# Altium schematic sheet Internal_Power_Sheet.SchDoc
size A4; DocumentNumber: 7; SheetNumber: 7; SheetTotal: 27
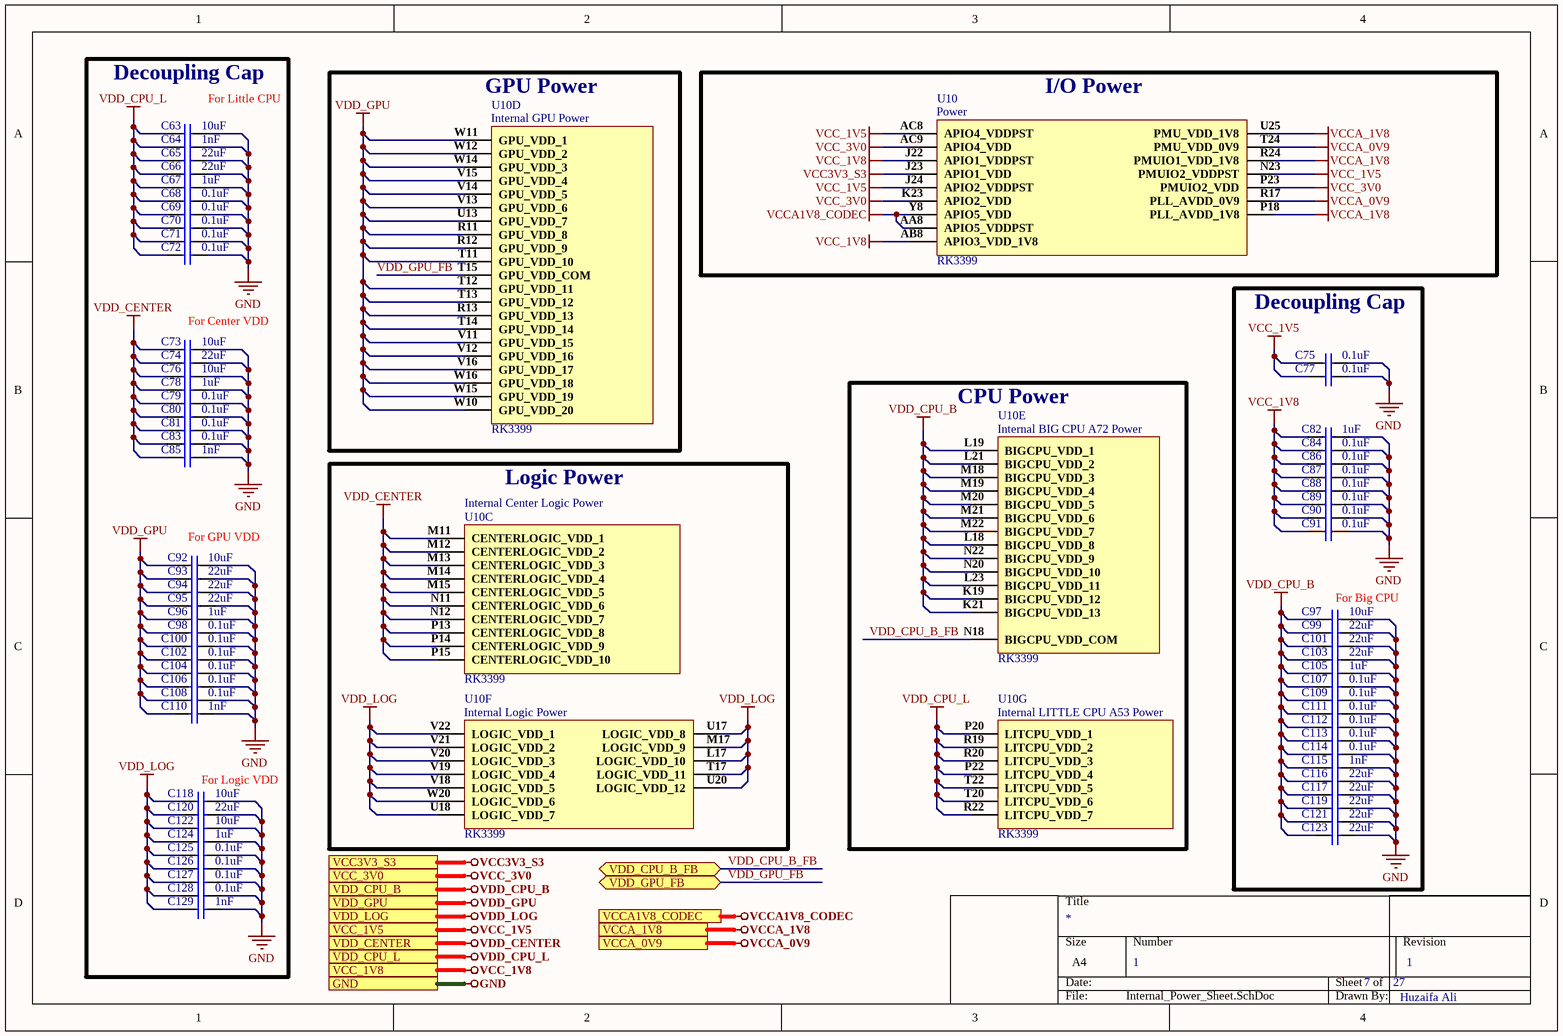
[diagram p0: Internal_Power_Sheet.SchDoc]

## Parts
C63  10uF  [Cap0603]
C64  1nF  [Cap0603]
C65  22uF  [Cap0805]
C66  22uF  [Cap0805]
C67  1uF  [Cap0402]
C68  0.1uF  [Cap0402]
C69  0.1uF  [Cap0402]
C70  0.1uF  [Cap0402]
C71  0.1uF  [Cap0402]
C72  0.1uF  [Cap0402]
C73  10uF  [Cap0603]
C74  22uF  [Cap0805]
C75  0.1uF  [Cap0402]
C76  10uF  [Cap0603]
C77  0.1uF  [Cap0402]
C78  1uF  [Cap0402]
C79  0.1uF  [Cap0402]
C80  0.1uF  [Cap0402]
C81  0.1uF  [Cap0402]
C82  1uF  [Cap0402]
C83  0.1uF  [Cap0402]
C84  0.1uF  [Cap0402]
C85  1nF  [Cap0603]
C86  0.1uF  [Cap0402]
C87  0.1uF  [Cap0402]
C88  0.1uF  [Cap0402]
C89  0.1uF  [Cap0402]
C90  0.1uF  [Cap0402]
C91  0.1uF  [Cap0402]
C92  10uF  [Cap0603]
C93  22uF  [Cap0805]
C94  22uF  [Cap0805]
C95  22uF  [Cap0805]
C96  1uF  [Cap0402]
C97  10uF  [Cap0603]
C98  0.1uF  [Cap0402]
C99  22uF  [Cap0805]
C100  0.1uF  [Cap0402]
C101  22uF  [Cap0805]
C102  0.1uF  [Cap0402]
C103  22uF  [Cap0805]
C104  0.1uF  [Cap0402]
C105  1uF  [Cap0402]
C106  0.1uF  [Cap0402]
C107  0.1uF  [Cap0402]
C108  0.1uF  [Cap0402]
C109  0.1uF  [Cap0402]
C110  1nF  [Cap0603]
C111  0.1uF  [Cap0402]
C112  0.1uF  [Cap 0402]
C113  0.1uF  [Cap0402]
C114  0.1uF  [Cap0402]
C115  1nF  [Cap0603]
C116  22uF  [Cap0805]
C117  22uF  [Cap0805]
C118  10uF  [Cap0603]
C119  22uF  [Cap0805]
C120  22uF  [Cap0805]
C121  22uF  [Cap0805]
C122  10uF  [Cap0603]
C123  22uF  [Cap0805]
C124  1uF  [Cap0402]
C125  0.1uF  [Cap0402]
C126  0.1uF  [Cap0402]
C127  0.1uF  [Cap0402]
C128  0.1uF  [Cap0402]
C129  1nF  [Cap0603]
U10  RK3399  [RK3399]  (parts C,D,E,F,G,29 of 34)

## Blocks framed on the sheet
Decoupling Cap: C63-C74 C76 C78-C81 C83 C85 C92-C96 C98 C100 C102 C104 C106 C108 C110 C118 C120 C122 C124-C129
GPU Power: U10
I/O Power: U10
Decoupling Cap: C75 C77 C82 C84 C86-C91 C97 C99 C101 C103 C105 C107 C109 C111-C117 C119 C121 C123
CPU Power: U10
Logic Power: U10

## Ports
GND, VCC3V3_S3, VCC_1V5, VCC_1V8, VCC_3V0, VCCA1V8_CODEC, VCCA_0V9, VCCA_1V8, VDD_CENTER, VDD_CPU_B, VDD_CPU_B_FB (bidir), VDD_CPU_L, VDD_GPU, VDD_GPU_FB (bidir), VDD_LOG

## Nets
GND: C63.2 C64.2 C65.2 C66.2 C67.2 C68.2 C69.2 C70.2 C71.2 C72.2 C73.2 C74.2 C75.2 C76.2 C77.2 C78.2 C79.2 C80.2 C81.2 C82.2 C83.2 C84.2 C85.2 C86.2 C87.2 C88.2 C89.2 C90.2 C91.2 C92.2 C93.2 C94.2 C95.2 C96.2 C97.2 C98.2 C99.2 C100.2 C101.2 C102.2 C103.2 C104.2 C105.2 C106.2 C107.2 C108.2 C109.2 C110.2 C111.2 C112.2 C113.2 C114.2 C115.2 C116.2 C117.2 C118.2 C119.2 C120.2 C121.2 C122.2 C123.2 C124.2 C125.2 C126.2 C127.2 C128.2 C129.2 ; port GND
VCC3V3_S3: U10.J23(APIO1_VDD) ; port VCC3V3_S3
VCC_1V5: C75.1 C77.1 U10.AC8(APIO4_VDDPST) U10.J24(APIO2_VDDPST) U10.N23(PMUIO2_VDDPST) ; port VCC_1V5
VCC_1V8: C82.1 C84.1 C86.1 C87.1 C88.1 C89.1 C90.1 C91.1 U10.AB8(APIO3_VDD_1V8) U10.J22(APIO1_VDDPST) ; port VCC_1V8
VCC_3V0: U10.AC9(APIO4_VDD) U10.K23(APIO2_VDD) U10.P23(PMUIO2_VDD) ; port VCC_3V0
VCCA1V8_CODEC: U10.AA8(APIO5_VDDPST) U10.Y8(APIO5_VDD) ; port VCCA1V8_CODEC
VCCA_0V9: U10.R17(PLL_AVDD_0V9) U10.T24(PMU_VDD_0V9) ; port VCCA_0V9
VCCA_1V8: U10.P18(PLL_AVDD_1V8) U10.R24(PMUIO1_VDD_1V8) U10.U25(PMU_VDD_1V8) ; port VCCA_1V8
VDD_CENTER: C73.1 C74.1 C76.1 C78.1 C79.1 C80.1 C81.1 C83.1 C85.1 U10.M11(CENTERLOGIC_VDD_1) U10.M12(CENTERLOGIC_VDD_2) U10.M13(CENTERLOGIC_VDD_3) U10.M14(CENTERLOGIC_VDD_4) U10.M15(CENTERLOGIC_VDD_5) U10.N11(CENTERLOGIC_VDD_6) U10.N12(CENTERLOGIC_VDD_7) U10.P13(CENTERLOGIC_VDD_8) U10.P14(CENTERLOGIC_VDD_9) U10.P15(CENTERLOGIC_VDD_10) ; port VDD_CENTER
VDD_CPU_B: C97.1 C99.1 C101.1 C103.1 C105.1 C107.1 C109.1 C111.1 C112.1 C113.1 C114.1 C115.1 C116.1 C117.1 C119.1 C121.1 C123.1 U10.K19(BIGCPU_VDD_12) U10.K21(BIGCPU_VDD_13) U10.L18(BIGCPU_VDD_8) U10.L19(BIGCPU_VDD_1) U10.L21(BIGCPU_VDD_2) U10.L23(BIGCPU_VDD_11) U10.M18(BIGCPU_VDD_3) U10.M19(BIGCPU_VDD_4) U10.M20(BIGCPU_VDD_5) U10.M21(BIGCPU_VDD_6) U10.M22(BIGCPU_VDD_7) U10.N20(BIGCPU_VDD_10) U10.N22(BIGCPU_VDD_9) ; port VDD_CPU_B
VDD_CPU_L: C63.1 C64.1 C65.1 C66.1 C67.1 C68.1 C69.1 C70.1 C71.1 C72.1 U10.P20(LITCPU_VDD_1) U10.P22(LITCPU_VDD_4) U10.R19(LITCPU_VDD_2) U10.R20(LITCPU_VDD_3) U10.R22(LITCPU_VDD_7) U10.T20(LITCPU_VDD_6) U10.T22(LITCPU_VDD_5) ; port VDD_CPU_L
VDD_GPU: C92.1 C93.1 C94.1 C95.1 C96.1 C98.1 C100.1 C102.1 C104.1 C106.1 C108.1 C110.1 U10.R11(GPU_VDD_8) U10.R12(GPU_VDD_9) U10.R13(GPU_VDD_13) U10.T11(GPU_VDD_10) U10.T12(GPU_VDD_11) U10.T13(GPU_VDD_12) U10.T14(GPU_VDD_14) U10.U13(GPU_VDD_7) U10.V11(GPU_VDD_15) U10.V12(GPU_VDD_16) U10.V13(GPU_VDD_6) U10.V14(GPU_VDD_5) U10.V15(GPU_VDD_4) U10.V16(GPU_VDD_17) U10.W10(GPU_VDD_20) U10.W11(GPU_VDD_1) U10.W12(GPU_VDD_2) U10.W14(GPU_VDD_3) U10.W15(GPU_VDD_19) U10.W16(GPU_VDD_18) ; port VDD_GPU
VDD_LOG: C118.1 C120.1 C122.1 C124.1 C125.1 C126.1 C127.1 C128.1 C129.1 U10.L17(LOGIC_VDD_10) U10.M17(LOGIC_VDD_9) U10.T17(LOGIC_VDD_11) U10.U17(LOGIC_VDD_8) U10.U18(LOGIC_VDD_7) U10.U20(LOGIC_VDD_12) U10.V18(LOGIC_VDD_5) U10.V19(LOGIC_VDD_4) U10.V20(LOGIC_VDD_3) U10.V21(LOGIC_VDD_2) U10.V22(LOGIC_VDD_1) U10.W20(LOGIC_VDD_6) ; port VDD_LOG
VDD_CPU_B_FB: U10.N18(BIGCPU_VDD_COM) ; port VDD_CPU_B_FB
VDD_GPU_FB: U10.T15(GPU_VDD_COM) ; port VDD_GPU_FB

## Notes on the sheet
- For Little CPU
- Text
- For Center VDD
- For GPU VDD
- (near C97) For Big CPU
- (near C118) For Logic VDD
- 1
- Huzaifa Ali
- (in symbol RK3399, part C) Internal Center Logic Power
- (in symbol RK3399, part D) Internal GPU Power
- (in symbol RK3399, part E) Internal BIG CPU A72 Power
- (in symbol RK3399, part F) Internal Logic Power
- (in symbol RK3399, part G) Internal LITTLE CPU A53 Power
- (in symbol RK3399, part 29) Power

## Library data of the parts
C63 C73 C76 C92 C97 C118 C122 = C1608X5R1E106M080AC: CAP CER 10UF 25V X5R 0603; Manufacturer: TDK; Dielectric Material: Ceramic; Tolerance: 20%; Supplier 1: Digi-Key; Manufacturer Part Number: C1608X5R1E106M080AC; Stock 1: 61681; Pricing 1: 1=0.96, 10=0.704, 100=0.483, 500=0.38238, 1000=0.322 (USD); Mount: Surface Mount; Case/Package: 0603; Weight: 7.1E-05oz; Case Code (Imperial): 0603; Case Code (Metric): 1608; Min Operating Temperature: -55°C; Max Operating Temperature: 85°C; Capacitance: 10uF; Packaging: Tape and Reel; Voltage Rating: 25V; Voltage Rating (DC): 25V; Termination: SMD/SMT; Package Quantity: 1; Dielectric: X5R; Composition: Ceramic; Length: 1.6mm; Height: 0.8mm; Width: 0.8mm; Thickness: 0.039inch; Depth: 0.8mm; Lead Free: Lead Free; REACH SVHC: No SVHC; Supplier Part Number 1: 445-9015-1-ND
C64 C85 C110 C115 C129 = CC0603KRX7R8BB102: CAP CER 0603 1nF 25 V ±10 % Tolerance X7R SMT; Manufacturer: Yageo; Tolerance: 10%; Voltage Rating: 25V; Supplier 1: Arrow Electronics; Manufacturer Part Number: CC0603KRX7R8BB102; RoHS: Yes; Category: Ceramic Capacitors; Stock 1: 974; Pricing 1: 1=0.07500, 10=0.04120, 25=0.04030, 100=0.02020, 250=0.02000, 500=0.01320 (USD); Mount: Surface Mount; Case/Package: 0603; Case Code (Imperial): 0603; Case Code (Metric): 1608; Weight: 7.1E-05oz; Min Operating Temperature: -55°C; Max Operating Temperature: 125°C; Capacitance: 1nF; Dielectric: X7R; Packaging: Tape and Reel; Voltage Rating (DC): 25V; Termination: SMD/SMT; Resistor Type: Ceramic; Series: CC; Construction: Flat; Length: 1.6mm; Width: 0.031inch; Height: 0.8mm; Thickness: 0.035inch; Depth: 0.8mm; Radiation Hardening: No; Lead Free: Lead Free; Halogen Free: Halogen Free; RoHS Compliant: Yes; ComponentLink1URL: https://datasheet.ciiva.com/13263/upy-gphc-x7r-6-3v-to-50v-8-12304-13263372.pdf?src-supplier=Mouser; ComponentLink1Description: https://datasheet.ciiva.com/13263/upy-gphc-x7r-6-3v-to-50v-8-12304-13263372.pdf?src-supplier=Mouser; Supplier Part Number 1: CC0603KRX7R8BB102
C65 C66 C74 C93-C95 C99 C101 C103 C116 C117 C119-C121 C123 = CL21A226MAYNNNE: 0803 22uF 25V X5R 20% multilayer ceramic capacitor; Manufacturer: Samsung; Supplier 1: Digi-Key; Manufacturer Part Number: CL21A226MAYNNNE; RoHS: Yes; Category: Ceramic Capacitors; Stock 1: 442950; Pricing 1: 2000=0.07687, 4000=0.07110, 10000=0.06726, 14000=0.06380, 50000=0.05765 (USD); RoHS Compliant: Yes; Supplier Part Number 1: 1276-CL21A226MAYNNNETR-ND
C67 C78 C82 C96 C105 C124 = GRM155R61E105KA12D: CAP CER 1UF 25V X5R 0402; Manufacturer: Murata; Material: Ceramic; Tolerance: 10%; Supplier 1: Digi-Key; Manufacturer Part Number: GRM155R61E105KA12D; Stock 1: 1194305; Pricing 1: 1=0.11, 10=0.077, 100=0.0363, 500=0.02546, 1000=0.02108, 2500=0.01962, 5000=0.01795 (USD); Mount: Surface Mount; Case/Package: 0402; Weight: 0.000212oz; Case Code (Metric): 1005; Case Code (Imperial): 0402; Min Operating Temperature: -55°C; Max Operating Temperature: 85°C; Capacitance: 1uF; Voltage Rating: 25V; Packaging: Tape and Reel; Dielectric: X5R; Voltage: 25V; Termination: SMD/SMT; Voltage Rating (DC): 25V; Package Quantity: 10000; Length: 1mm; Height: 0.5mm; Width: 0.5mm; Thickness: 0.022inch; Depth: 0.5mm; REACH SVHC: No SVHC; Lead Free: Lead Free; ComponentLink1URL: http://www.farnell.com/datasheets/2048341.pdf?src-supplier=Element14; ComponentLink1Description: http://www.farnell.com/datasheets/2048341.pdf?src-supplier=Element14; Supplier Part Number 1: 490-10017-1-ND
C68-C72 C75 C77 C79-C81 C83 C84 C86-C91 C98 C100 C102 C104 C106-C109 C111 C113 C114 C125-C128 = CC0402KRX5R6BB104: CAP CER 0.1UF 10V X5R 0402; Manufacturer: Yageo; Capacitance: 100nF; Tolerance: 10%; Dissipation Factor: 5%; Insulation Resistance: 10GR; Supplier 1: Digi-Key; Manufacturer Part Number: CC0402KRX5R6BB104; RoHS: Yes; Category: Ceramic Capacitors; Stock 1: 6385580; Pricing 1: 1=0.10000, 10=0.02700, 50=0.01500, 100=0.01220, 500=0.00874, 1000=0.00687, 2500=0.00625, 5000=0.00575 (USD); Mount: Surface Mount; Case/Package: 0402; Number of Pins: 2; Case Code (Imperial): 0402; Case Code (Metric): 1005; Min Operating Temperature: -55°C; Max Operating Temperature: 85°C; Dielectric: X5R; Packaging: Tape and Reel; Voltage Rating: 10V; Package Quantity: 1; Termination: SMD/SMT; Voltage Rating (DC): 10V; Series: CC; Length: 1mm; Width: 0.02inch; Height: 0.5mm; Depth: 0.5mm; Thickness: 0.022inch; Radiation Hardening: No; RoHS Compliant: Yes; REACH SVHC: No SVHC; Lead Free: Lead Free; Halogen Free: Halogen Free; ComponentLink1URL: https://datasheet.ciiva.com/144/mlccorderingcode-144029.pdf?src-supplier=Digi-Key; ComponentLink1Description: https://datasheet.ciiva.com/144/mlccorderingcode-144029.pdf?src-supplier=Digi-Key; ComponentLink2URL: https://datasheet.ciiva.com/144/mlccorderingcode-144028.pdf?src-supplier=Digi-Key; ComponentLink2Description: https://datasheet.ciiva.com/144/mlccorderingcode-144028.pdf?src-supplier=Digi-Key; ComponentLink3URL: https://datasheet.ciiva.com/144/mlccorderingcode-144030.pdf?src-supplier=Digi-Key; ComponentLink3Description: https://datasheet.ciiva.com/144/mlccorderingcode-144030.pdf?src-supplier=Digi-Key; ComponentLink4URL: https://datasheet.ciiva.com/7978/1359354-7978091.pdf?src-supplier=Element14; ComponentLink4Description: https://datasheet.ciiva.com/7978/1359354-7978091.pdf?src-supplier=Element14; ComponentLink5URL: https://datasheet.ciiva.com/11587/upy-gphc-x5r-4v-to-50v-12-11587302.pdf?src-supplier=Avnet; ComponentLink5Description: https://datasheet.ciiva.com/11587/upy-gphc-x5r-4v-to-50v-12-11587302.pdf?src-supplier=Avnet; Supplier Part Number 1: 311-1336-1-ND
C112 = GRM155R71H104ME14D: CAP CER 0.1UF 50V X7R 0402; Manufacturer: Murata; Tolerance: 20%; Capacitance: 100nF; Supplier 1: Digi-Key; Manufacturer Part Number: GRM155R71H104ME14D; Stock 1: 439844; Pricing 1: 1=0.1, 10=0.038, 100=0.0168, 500=0.01198, 1000=0.00941, 2500=0.00855, 5000=0.00787 (USD); Mount: Surface Mount; Case/Package: 0402; Min Operating Temperature: -55°C; Max Operating Temperature: 125°C; Packaging: Cut Tape; Voltage Rating: 50V; Length: 0.039inch; Width: 0.02inch; Thickness: 0.022inch; ComponentLink1URL: http://search.murata.co.jp/Ceramy/image/img/A01X/G101/ENG/GRM155R71H104ME14-01.pdf?src-supplier=Digi-Key; ComponentLink1Description: http://search.murata.co.jp/Ceramy/image/img/A01X/G101/ENG/GRM155R71H104ME14-01.pdf?src-supplier=Digi-Key; ComponentLink2URL: http://psearch.en.murata.com/capacitor/product/GRM155R71H104ME14%23.pdf?src-supplier=Avnet; ComponentLink2Description: http://psearch.en.murata.com/capacitor/product/GRM155R71H104ME14%23.pdf?src-supplier=Avnet; ComponentLink3URL: http://components.arrow.com/part/dataview/0323_07177683?src-supplier=Arrow+Europe; ComponentLink3Description: http://components.arrow.com/part/dataview/0323_07177683?src-supplier=Arrow+Europe; ComponentLink4URL: http://www.mouser.com/ds/2/281/c02e-2905.pdf?src-supplier=Mouser; ComponentLink4Description: http://www.mouser.com/ds/2/281/c02e-2905.pdf?src-supplier=Mouser; Supplier Part Number 1: 490-10701-1-ND
U10 = RK3399: RK3399 CPU BGA for HD set-top box chip BGA Chipse; Manufacturer: Fuzhou Rockchip Electronics; ComponentLink1Description: Aliexpress; ComponentLink1URL: https://www.aliexpress.com/item/1005001971093459.html?spm=a2g0n.productlist.0.0.3c7csv8Qsv8Quh&browser_id=3ac7e9efb8074641aaabc4d871f09748&aff_trace_key=&aff_platform=msite&m_page_id=181389a08711fc2600d8cc522bab8d702dd4189be0&gclid=&pdp_npi=2%40dis%21USD%21%2123.6%21%21%21%21%21%402101d91e16545120399167831e8b89%21%21sea&algo_pvid=4303aedd-774c-4013-953d-920f10b55003; Manufacturer Part Number: RK3399; Footprint: FCBGA828